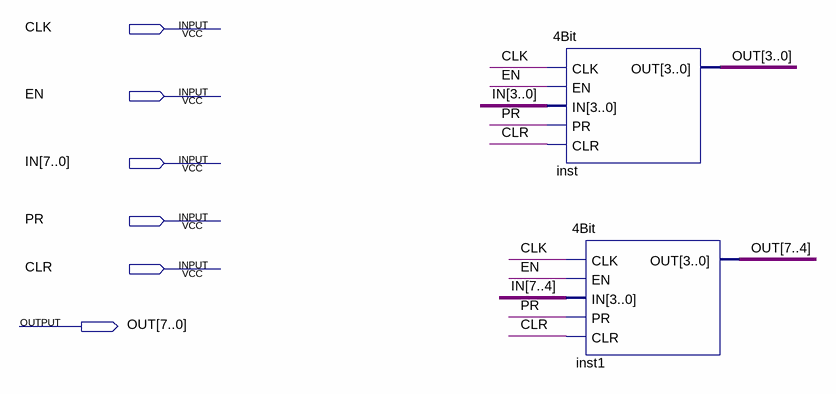
[diagram p0: schematic sheet]
// Quartus schematic 8Bit.bdf as structural Verilog: 2 symbols, 6 pins
module \8Bit  (
  input  CLK,
  input  EN,
  input  [7:0] IN,
  input  PR,
  input  CLR,
  output [7:0] OUT
);

  \4Bit  inst (.CLK(CLK), .EN(EN), .IN(IN[3:0]), .PR(PR), .CLR(CLR), .OUT(OUT[3:0]));
  \4Bit  inst1 (.CLK(CLK), .EN(EN), .IN(IN[7:4]), .PR(PR), .CLR(CLR), .OUT(OUT[7:4]));
endmodule
